# Altium schematic sheet USB HUB_Section.SchDoc
size 420 x 297 mm; SheetNumber: 6; SheetTotal: 6
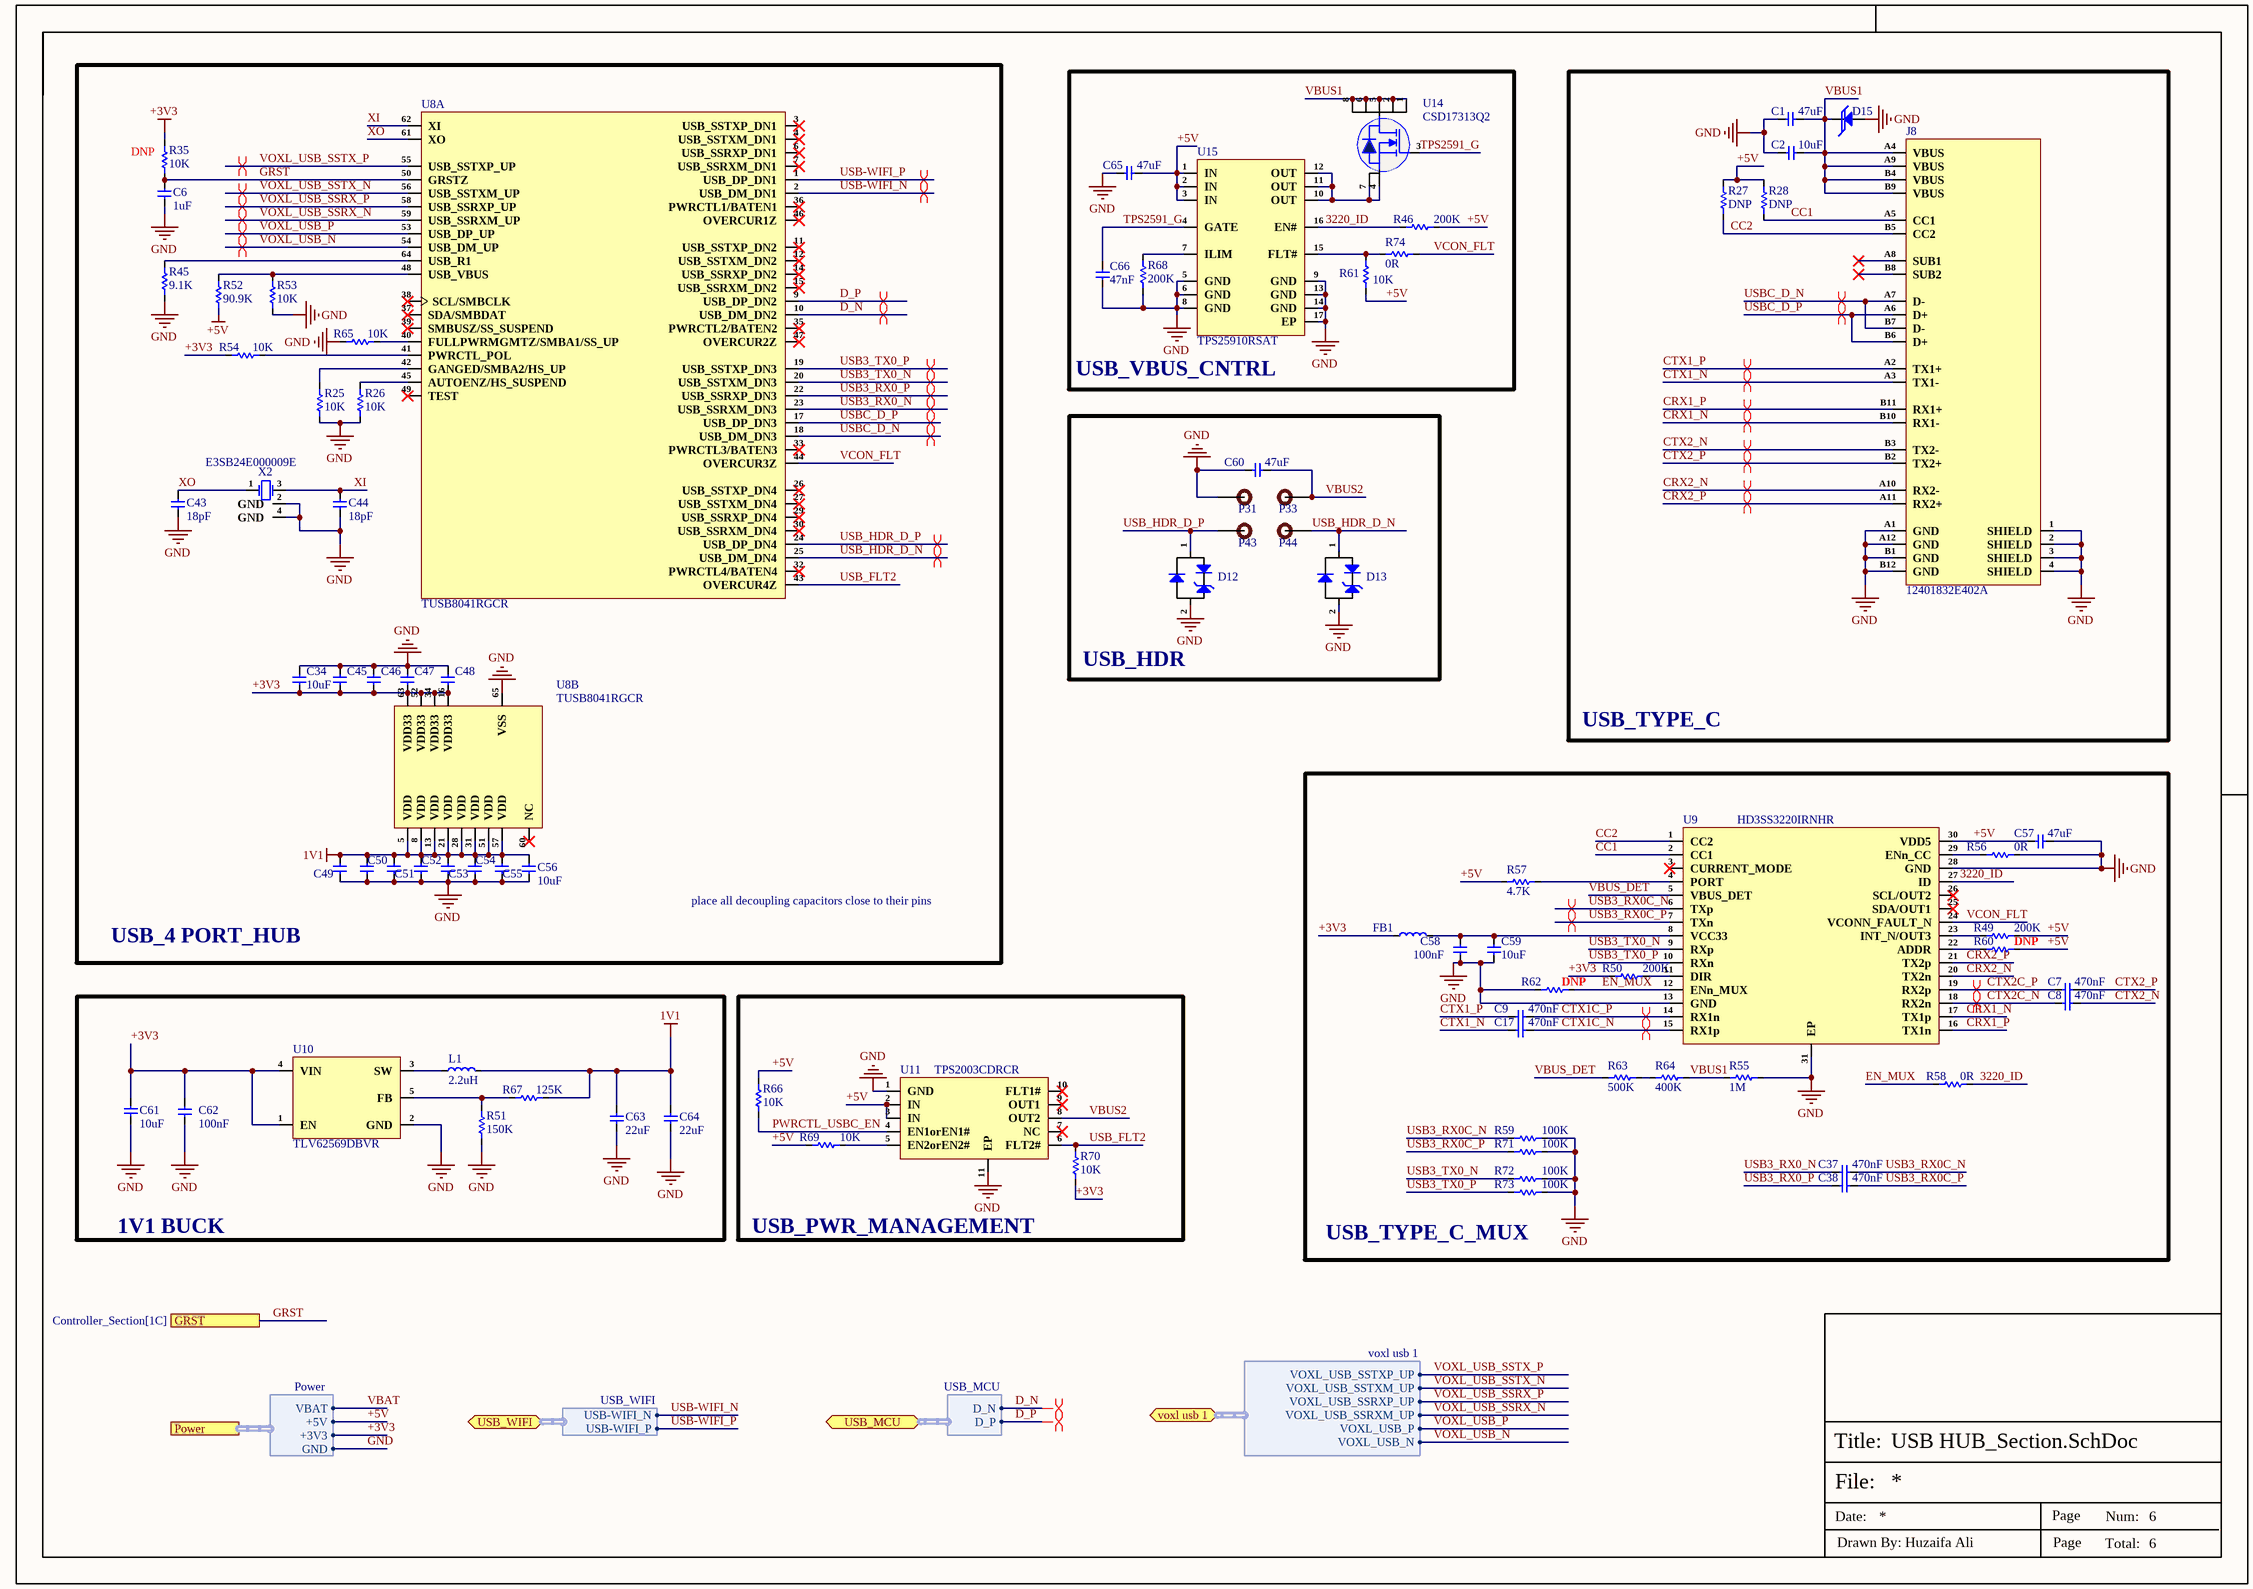
[diagram p0: USB HUB_Section.SchDoc]

## Parts
C1  47uF  [Cap-0805]
C2  10uF  [Cap-0603]
C6  1uF  [Cap-0402]
C7  470nF  [Cap-0402]
C8  470nF  [Cap-0402]
C9  470nF  [Cap-0402]
C17  470nF  [Cap-0402]
C34  10uF  [Cap-0603]
C37  470nF  [Cap-0402]
C38  470nF  [Cap-0402]
C43  18pF  [Cap-0402]
C44  18pF  [Cap-0402]
C45  0.01uF  [Cap-0402]  (value not drawn)
C46  0.01uF  [Cap-0402]  (value not drawn)
C47  0.01uF  [Cap-0402]  (value not drawn)
C48  0.01uF  [Cap-0402]  (value not drawn)
C49  0.01uF  [Cap-0402]  (value not drawn)
C50  0.01uF  [Cap-0402]  (value not drawn)
C51  0.01uF  [Cap-0402]  (value not drawn)
C52  0.01uF  [Cap-0402]  (value not drawn)
C53  0.01uF  [Cap-0402]  (value not drawn)
C54  0.01uF  [Cap-0402]  (value not drawn)
C55  0.01uF  [Cap-0402]  (value not drawn)
C56  10uF  [Cap-0603]
C57  47uF  [Cap-0805]
C58  100nF  [cap-0402]
C59  10uF  [Cap-0603]
C60  47uF  [Cap-0805]
C61  10uF  [Cap-0603]
C62  100nF  [cap-0402]
C63  22uF  [Cap-0402]
C64  22uF  [Cap-0402]
C65  47uF  [Cap-0805]
C66  47nF  [Cap-0402]
D12  ESD5341N-2/TR  [DFN1006-2L_]  (value not drawn)
D13  ESD5341N-2/TR  [DFN1006-2L_]  (value not drawn)
D15  ESD5Z6.0T1G  [SOD-523]  (value not drawn)
FB1  HPZ1005D221R50TF  [IND-0402]  (value not drawn)
J8  12401832E402A  [12401832E402A]
L1  2.2uH  [YSPI0520-2R2M_]
P31  TEST POINT  [Test-point]  (value not drawn)
P33  TEST POINT  [Test-point]  (value not drawn)
P43  TEST POINT  [Test-point]  (value not drawn)
P44  TEST POINT  [Test-point]  (value not drawn)
R25  10K  [Res-0402]
R26  10K  [Res-0402]
R27  DNP  [Res-0402]
R28  DNP  [Res-0402]
R35  10K  [Res-0402]
R45  9.1K  [Res-0402]
R46  200K  [Res-0402]
R49  200K  [Res-0402]
R50  200K  [Res-0402]
R51  150K  [Res-0402]
R52  90.9K  [Res-0402]
R53  10K  [Res-0402]
R54  10K  [Res-0402]
R55  1M  [Res-0603]
R56  0R  [Res-0402]
R57  4.7K  [Res-0402]
R58  0R  [Res-0402]
R59  100K  [Res-0402]
R60  DNP  [Res-0402]
R61  10K  [Res-0402]
R62  DNP  [Res-0402]
R63  500K  [Res-0603]
R64  400K  [RES-0805]
R65  10K  [Res-0402]
R66  10K  [Res-0402]
R67  125K  [RES-0805]
R68  200K  [Res-0402]
R69  10K  [Res-0402]
R70  10K  [Res-0402]
R71  100K  [Res-0402]
R72  100K  [Res-0402]
R73  100K  [Res-0402]
R74  0R  [Res-0402]
U8  TUSB8041RGCR  [64-VQFN (9x9)]  (parts A,B of 2)
U9  HD3SS3220IRNHR  [WQFN-30-EP(2.5x4.5)]
U10  TLV62569DBVR  [SOT-23-5]
U11  TPS2003CDRCR  [VSON-10-EP(3x3)]
U14  CSD17313Q2  [CSD17313Q2]
U15  TPS25910RSAT  [16-QFN (4x4)]
X2  E3SB24E000009E  [SMD3225-4P]

## Blocks framed on the sheet
USB_4 PORT_HUB: C6 C34 C43-C56 R25 R26 R35 R45 R52-R54 R65 U8 X2
USB_VBUS_CNTRL: C65 C66 R46 R61 R68 R74 U14 U15
USB_TYPE_C: C1 C2 D15 J8 R27 R28
USB_HDR: C60 D12 D13 P31 P33 P43 P44
USB_TYPE_C_MUX: C7-C9 C17 C37 C38 C57-C59 FB1 R49 R50 R55-R60 R62-R64 R71-R73 U9
1V1 BUCK: C61-C64 L1 R51 R67 U10
USB_PWR_MANAGEMENT: R66 R69 R70 U11

## Ports
GRST (see Controller_Section[1C]), Power (harness Power, see Connector_Section[4D], Controller_Section[2D], FlashMemory_Section[1D], Power_Section[3D], RTC_Section[2D], WiFiModule_Section[3D]), USB_MCU (bidir, harness USB_MCU, see Controller_Section[2D]), USB_WIFI (bidir, harness USB_WIFI, see WiFiModule_Section[3D]), voxl usb 1 (bidir, harness voxl usb 1, see Connector_Section[4D])

## Harnesses
Power: +5V, +3V3, GND, VBAT
USB_WIFI: USB-WIFI_N, USB-WIFI_P
USB_MCU: D_N, D_P
voxl usb 1: VOXL_USB_SSTXP_UP, VOXL_USB_SSTXM_UP, VOXL_USB_SSRXP_UP, VOXL_USB_SSRXM_UP, VOXL_USB_P, VOXL_USB_N

## Nets
1V1: C49.2 C50.2 C51.2 C52.2 C53.2 C54.2 C55.2 C56.2 C63.2 C64.2 L1.2 R67.2 U8.5(VDD) U8.8(VDD) U8.13(VDD) U8.21(VDD) U8.28(VDD) U8.31(VDD) U8.51(VDD) U8.57(VDD)
+3V3: C34.1 C45.1 C46.1 C47.1 C48.1 C61.1 C62.2 FB1.1 R35.2 R50.2 R54.2 R70.1 U8.16(VDD33) U8.34(VDD33) U8.52(VDD33) U8.63(VDD33) U10.1(EN) U10.4(VIN) ; port Power.+3V3
+5V: C57.1 C65.2 R27.2 R28.2 R46.2 R49.1 R52.1 R57.1 R60.1 R61.1 R66.2 R69.1 U9.30(VDD5) U11.2(IN) U11.3(IN) U15.1(IN) U15.2(IN) U15.3(IN) ; port Power.+5V
GND: C1.1 C2.2 C6.1 C34.2 C43.1 C44.1 C45.2 C46.2 C47.2 C48.2 C49.1 C50.1 C51.1 C52.1 C53.1 C54.1 C55.1 C56.1 C57.2 C58.1 C59.1 C60.1 C61.2 C62.1 C63.1 C64.1 C65.1 C66.1 D12.2(A) D13.2(A) D15.1 J8.1(SHIELD) J8.2(SHIELD) J8.3(SHIELD) J8.4(SHIELD) J8.A1(GND) J8.A12(GND) J8.B1(GND) J8.B12(GND) P31.1 R25.1 R26.1 R45.1 R51.1 R53.2 R55.2 R56.2 R59.2 R62.1 R65.2 R68.1 R71.2 R72.2 R73.2 U8.65(VSS) U9.13(GND) U9.28(GND) U9.31(EP) U10.2(GND) U11.1(GND) U11.11(EP) U15.5(GND) U15.6(GND) U15.8(GND) U15.9(GND) U15.13(GND) U15.14(GND) U15.17(EP) X2.2(GND) X2.4(GND) ; port Power.GND
3220_ID: R46.1 R58.2 U9.27(ID) U15.16(EN#)
CC1: J8.A5(CC1) R28.1 U9.2(CC1)
CC2: J8.B5(CC2) R27.1 U9.1(CC2)
CRX1_N: J8.B10(RX1-) U9.17(TX1p)
CRX1_P: J8.B11(RX1+) U9.16(TX1n)
CRX2_N: J8.A10(RX2-) U9.20(TX2n)
CRX2_P: J8.A11(RX2+) U9.21(TX2p)
CTX1_N: C17.1 J8.A3(TX1-)
CTX1_P: C9.1 J8.A2(TX1+)
CTX1C_N: C17.2 U9.15(RX1p)
CTX1C_P: C9.2 U9.14(RX1n)
CTX2_N: C8.2 J8.B3(TX2-)
CTX2_P: C7.2 J8.B2(TX2+)
CTX2C_N: C8.1 U9.18(RX2n)
CTX2C_P: C7.1 U9.19(RX2p)
D_N: U8.10(USB_DM_DN2) ; port USB_MCU.D_N
D_P: U8.9(USB_DP_DN2) ; port USB_MCU.D_P
EN_MUX: R58.1 R62.2 U9.12(ENn_MUX)
GRST: C6.2 R35.1 U8.50(GRSTZ) ; port GRST
PWRCTL_USBC_EN: R66.1 U11.4(EN1orEN1#)
TPS2591_G: C66.2 U14.3(G) U15.4(GATE)
USB3_RX0_N: C37.1 U8.23(USB_SSRXM_DN3)
USB3_RX0_P: C38.1 U8.22(USB_SSRXP_DN3)
USB3_RX0C_N: C37.2 R59.1 U9.6(TXp)
USB3_RX0C_P: C38.2 R71.1 U9.7(TXn)
USB3_TX0_N: R72.1 U8.20(USB_SSTXM_DN3) U9.9(RXp)
USB3_TX0_P: R73.1 U8.19(USB_SSTXP_DN3) U9.10(RXn)
USB-WIFI_N: U8.2(USB_DM_DN1) ; port USB_WIFI.USB-WIFI_N
USB-WIFI_P: U8.1(USB_DP_DN1) ; port USB_WIFI.USB-WIFI_P
USB_FLT2: R70.2 U8.43(OVERCUR4Z) U11.6(FLT2#)
USB_HDR_D_N: D13.1(K) P44.1 U8.25(USB_DM_DN4)
USB_HDR_D_P: D12.1(K) P43.1 U8.24(USB_DP_DN4)
USBC_D_N: J8.A7(D-) J8.B7(D-) U8.18(USB_DM_DN3)
USBC_D_P: J8.A6(D+) J8.B6(D+) U8.17(USB_DP_DN3)
VBAT: port Power.VBAT
VBUS1: C1.2 C2.1 D15.2 J8.A4(VBUS) J8.A9(VBUS) J8.B4(VBUS) J8.B9(VBUS) R55.1 R64.1 U14.1(D) U14.2(D) U14.5(D) U14.6(D) U14.8(D)
VBUS2: C60.2 P33.1 U11.8(OUT2)
VBUS_DET: R63.2 U9.5(VBUS_DET)
VCON_FLT: R74.2 U8.44(OVERCUR3Z) U9.24(VCONN_FAULT_N)
VOXL_USB_N: U8.54(USB_DM_UP) ; port voxl usb 1.VOXL_USB_N
VOXL_USB_P: U8.53(USB_DP_UP) ; port voxl usb 1.VOXL_USB_P
VOXL_USB_SSRX_N: U8.59(USB_SSRXM_UP) ; port voxl usb 1.VOXL_USB_SSRXM_UP
VOXL_USB_SSRX_P: U8.58(USB_SSRXP_UP) ; port voxl usb 1.VOXL_USB_SSRXP_UP
VOXL_USB_SSTX_N: U8.56(USB_SSTXM_UP) ; port voxl usb 1.VOXL_USB_SSTXM_UP
VOXL_USB_SSTX_P: U8.55(USB_SSTXP_UP) ; port voxl usb 1.VOXL_USB_SSTXP_UP
XI: C44.2 U8.62(XI) X2.3(OSC2)
XO: C43.2 U8.61(XO) X2.1(OSC1)
NetC58_2: C58.2 C59.2 FB1.2 U9.8(VCC33)
NetL1_1: L1.1 U10.3(SW)
NetR25_2: R25.2 U8.42(GANGED/SMBA2/HS_UP)
NetR26_2: R26.2 U8.45(AUTOENZ/HS_SUSPEND)
NetR45_2: R45.2 U8.64(USB_R1)
NetR49_2: R49.2 U9.23(INT_N/OUT3)
NetR50_1: R50.1 U9.11(DIR)
NetR51_2: R51.2 R67.1 U10.5(FB)
NetR52_2: R52.2 R53.1 U8.48(USB_VBUS)
NetR54_1: R54.1 U8.41(PWRCTL_POL)
NetR56_1: R56.1 U9.29(ENn_CC)
NetR57_2: R57.2 U9.4(PORT)
NetR60_2: R60.2 U9.22(ADDR)
NetR61_2: R61.2 R74.1 U15.15(FLT#)
NetR63_1: R63.1 R64.2
NetR65_1: R65.1 U8.40(FULLPWRMGMTZ/SMBA1/SS_UP)
NetR68_2: R68.2 U15.7(ILIM)
NetR69_2: R69.2 U11.5(EN2orEN2#)
NetU14_4: U14.4(S) U14.7(S) U15.10(OUT) U15.11(OUT) U15.12(OUT)

Not connected (* = marked no-connect by the designer): J8 A8(SUB1)* B8(SUB2)*; U8 3(USB_SSTXP_DN1)* 4(USB_SSTXM_DN1)* 6(USB_SSRXP_DN1)* 7(USB_SSRXM_DN1)* 11(USB_SSTXP_DN2)* 12(USB_SSTXM_DN2)* 14(USB_SSRXP_DN2)* 15(USB_SSRXM_DN2)* 26(USB_SSTXP_DN4)* 27(USB_SSTXM_DN4)* 29(USB_SSRXP_DN4)* 30(USB_SSRXM_DN4)* 32(PWRCTL4/BATEN4)* 33(PWRCTL3/BATEN3)* 35(PWRCTL2/BATEN2)* 36(PWRCTL1/BATEN1)* 37(SDA/SMBDAT)* 38(SCL/SMBCLK)* 39(SMBUSZ/SS_SUSPEND)* 46(OVERCUR1Z)* 47(OVERCUR2Z)* 49(TEST)* 60(NC)*; U9 3(CURRENT_MODE)* 25(SDA/OUT1)* 26(SCL/OUT2)*; U11 7(NC)* 9(OUT1)* 10(FLT1#)*

## Layout directives
differential pair; rule Impedance Constraint [Min = 88.00    Max = 102.0    ]; rule Matched Net Lengths [Tolerance = 0.508mm]; net class D; differential pair class D_Lines: D_N, D_P, USB-WIFI_N, USB-WIFI_P, USB_HDR_D_N, USB_HDR_D_P, USBC_D_N, USBC_D_P
differential pair; differential pair class DP_LINES: CRX1_N, CRX1_P, CRX2_N, CRX2_P, CTX1_N, CTX1_P, CTX1C_N, CTX1C_P, CTX2_N, CTX2_P, CTX2C_N, CTX2C_P, USB3_RX0C_N, USB3_RX0C_P
differential pair; rule Impedance Constraint [Min = 88.00    Max = 102.0    ]; rule Matched Net Lengths [Tolerance = 0.508mm]; net class D_SS; differential pair class D_SS_Lines: USB3_RX0_N, USB3_RX0_P, USB3_TX0_N, USB3_TX0_P
differential pair; differential pair class USB_LINES: USBC_D_N, USBC_D_P
differential pair; net class VOXL_SS_USB; differential pair class VOXL_SS_USB_Lines; rule Matched Net Lengths [Tolerance = 0.508mm]; rule Impedance Constraint [Min = 88.00    Max = 102.0    ]: VOXL_USB_SSRX_N, VOXL_USB_SSRX_P, VOXL_USB_SSTX_N, VOXL_USB_SSTX_P
differential pair; net class VOXL_USB; differential pair class VOXL_USB_Lines; rule Matched Net Lengths [Tolerance = 0.508mm]; rule Impedance Constraint [Min = 88.00    Max = 102.0    ]: VOXL_USB_N, VOXL_USB_P

## Notes on the sheet
- (near R35) DNP
- place all decoupling capacitors close to their pins
- File:
- Title:
- Date:
- Page
- Num:
- Total:
- Drawn By: Huzaifa Ali

## Library data of the parts
C1 C57 C60 C65 = CGA0805X5R476M100MT: 10V 47uF X5R ±20% 0805 Multilayer Ceramic Capacitors MLCC - SMD/SMT ROHS; Manufacturer: HRE; ComponentLink1Description: LCSC; ComponentLink1URL: https://www.lcsc.com/product-detail/Multilayer-Ceramic-Capacitors-MLCC-SMD-SMT_HRE-CGA0805X5R476M100MT_C6119904.html; Manufacturer Part Number: CGA0805X5R476M100MT; Package: 0805; LCSC Part Number: C6119904; Item Type: Capacitor
C2 C34 C56 C59 C61 = GRM188R61E106KA73D: CAP CER 10UF 25V X5R 0603; Manufacturer: Murata; Supplier 1: Mouser; Manufacturer Part Number: GRM188R61E106KA73D; RoHS: Yes; Category: Ceramic Capacitors; Stock 1: 319428; Pricing 1: 1=0.36000, 10=0.25800, 50=0.25800, 100=0.15500, 1000=0.09800, 10000=0.06900 (USD); Case/Package: 0603; RoHS Compliant: Yes; ComponentLink1URL: https://search.murata.co.jp/Ceramy/image/img/A01X/G101/ENG/GRM188R61E106KA73-01.pdf?src-supplier=Digi-Key; ComponentLink1Description: https://search.murata.co.jp/Ceramy/image/img/A01X/G101/ENG/GRM188R61E106KA73-01.pdf?src-supplier=Digi-Key; Supplier Part Number 1: 81-GRM188R61E106KA3D; LCSC Part Number: C344022
C6 = CC0402KRX5R8BB105: CAP CER 1UF 25V X5R 0402; Manufacturer: Yageo; Tolerance: 10%; Supplier 1: Mouser; Manufacturer Part Number: CC0402KRX5R8BB105; RoHS: Yes; Category: Ceramic Capacitors; Stock 1: 91975; Pricing 1: 1=0.30000, 10=0.20400, 50=0.20400, 100=0.11600, 1000=0.07200, 10000=0.05900 (USD); Mount: Surface Mount; Case/Package: 0402; Case Code (Metric): 1005; Case Code (Imperial): 0402; Weight: 2.3E-05oz; Min Operating Temperature: -55°C; Max Operating Temperature: 85°C; Packaging: Tape and Reel; Capacitance: 1uF; Voltage Rating: 25V; Dielectric: X5R; Termination: SMD/SMT; Voltage Rating (DC): 25V; Package Quantity: 10000; Length: 0.039inch; Width: 0.02inch; Thickness: 0.022inch; Lead Free: Lead Free; Halogen Free: Halogen Free; RoHS Compliant: Yes; ComponentLink1URL: http://www.mouser.com/ds/2/447/Yageo_UPY-GP_NP0_16V-to-50V_9-358835.pdf?src-supplier=Mouser; ComponentLink1Description: http://www.mouser.com/ds/2/447/Yageo_UPY-GP_NP0_16V-to-50V_9-358835.pdf?src-supplier=Mouser; ComponentLink2URL: http://www.yageo.com/documents/recent/UPY-GPHC_X5R_4V-to-50V_25.pdf?src-supplier=Digi-Key; ComponentLink2Description: http://www.yageo.com/documents/recent/UPY-GPHC_X5R_4V-to-50V_25.pdf?src-supplier=Digi-Key; ComponentLink3URL: https://4donline.ihs.com/images/VipMasterIC/IC/YAGO/YAGO-S-A0006851646/YAGO-S-A0006851646-1.pdf?hkey=6D3A4C79FDBF58556ACFDE234799DDF0&src-supplier=Newark; ComponentLink3Description: https://4donline.ihs.com/images/VipMasterIC/IC/YAGO/YAGO-S-A0006851646/YAGO-S-A0006851646-1.pdf?hkey=6D3A4C79FDBF58556ACFDE234799DDF0&src-supplier=Newark; Supplier Part Number 1: 603-CC402KRX5R8BB105; LCSC Part Number: C326568
C7-C9 C17 C37 C38 = CL05A474KA5NNNC: CAP CER 0.47UF 25V X5R 0402; Manufacturer: Samsung; Material: Ceramic; Tolerance: 10%; Supplier: Avnet; Supplier Part Number: CL05A474KA5NNNC; Manufacturer Part Number: CL05A474KA5NNNC; RoHS: Yes; Category: Ceramic Capacitors; Stock: 80000; Pricing: 100000=0.02563 (USD); Mounting Technology: Surface Mount; Case/Package: 0402; Case Code (Metric): 1005; Case Code (Imperial): 0402; Min Operating Temperature: -55°C; Max Operating Temperature: 85°C; Packaging: Cut Tape; Value: 470nF; Voltage Rating (DC): 25V; Voltage Rating: 25V; Series: CL; Height: 550um; Lead Free: Lead Free; RoHS Compliant: Yes; ComponentLink1URL: https://datasheet.ciiva.com/25796/cl05a474ka5nnnc-25796037.pdf?src-supplier=Digikey; ComponentLink1Description: https://datasheet.ciiva.com/25796/cl05a474ka5nnnc-25796037.pdf?src-supplier=Digikey; ComponentLink2URL: https://datasheet.ciiva.com/29198/458859-da-01-en-vs-kondensator-0402-29198303.pdf?src-supplier=Conrad; ComponentLink2Description: https://datasheet.ciiva.com/29198/458859-da-01-en-vs-kondensator-0402-29198303.pdf?src-supplier=Conrad
C43 C44 = GCM1555C1H180GA16D: CAP CER 18PF 50V C0G/NP0 0402; Manufacturer: Murata; Tolerance: 2%; Item Type: Capacitor; Supplier: Rs; Supplier Part Number: 2477793P; Manufacturer Part Number: GCM1555C1H180GA16D; RoHS: Yes; Category: Ceramic Capacitors; Stock: 10000; Pricing: 500=0.013, 5000=0.009 (GBP); Mounting Technology: Surface Mount; Case/Package: 0402; Case Code (Imperial): 0402; Case Code (Metric): 1005; Min Operating Temperature: -55°C; Max Operating Temperature: 125°C; Packaging: Cut Tape; Value: 18pF; Voltage Rating: 50V; Series: GCM; Ratings: AEC-Q200; RoHS Compliant: Yes; ComponentLink1URL: http://search.murata.co.jp/Ceramy/image/img/A01X/G101/ENG/GCM1555C1H180GA16-01.pdf?src-supplier=Digi-Key; ComponentLink1Description: http://search.murata.co.jp/Ceramy/image/img/A01X/G101/ENG/GCM1555C1H180GA16-01.pdf?src-supplier=Digi-Key; ComponentLink2URL: https://search.murata.co.jp/Ceramy/image/img/A01X/G101/ENG/GCM1555C1H180GA16-01.pdf?src-supplier=Digi-Key; ComponentLink2Description: https://search.murata.co.jp/Ceramy/image/img/A01X/G101/ENG/GCM1555C1H180GA16-01.pdf?src-supplier=Digi-Key; ComponentLink3URL: https://datasheet.octopart.com/GCM1555C1H180GA16D-Murata-datasheet-149522315.pdf?src-supplier=Newark; ComponentLink3Description: https://datasheet.octopart.com/GCM1555C1H180GA16D-Murata-datasheet-149522315.pdf?src-supplier=Newark; ComponentLink4URL: https://datasheet.octopart.com/GCM1555C1H180GA16D-Murata-datasheet-12511495.pdf?src-supplier=TME; ComponentLink4Description: https://datasheet.octopart.com/GCM1555C1H180GA16D-Murata-datasheet-12511495.pdf?src-supplier=TME; LCSC Part Number: C882583
C45-C55 = CC0402KRX5R8BB103: CAP CER 10000PF 25V X5R 0402; Manufacturer: Yageo; Item Type: Capacitor; Supplier 1: Future Electronics; Manufacturer Part Number: CC0402KRX5R8BB103; RoHS: Yes; Category: Ceramic Capacitors; Stock 1: 140000; Pricing 1: 10000=0.00290, 40000=0.00270, 150000=0.00260, 250000=0.00250, 500000=0.00240 (USD); RoHS Compliant: Yes; Supplier Part Number 1: 2101932; LCSC Part Number: C576726; ComponentLink1Description: LCSC; ComponentLink1URL: https://www.lcsc.com/product-detail/Multilayer-Ceramic-Capacitors-MLCC-SMD-SMT_YAGEO-CC0402KRX5R8BB103_C576726.html
C58 C62 = C1005X7R1H104KT000F: CAP CER 0.1UF 50V X7R 0402; Manufacturer: TDK; Tolerance: 10%; Voltage: 25V; Item Type: Capacitor; Supplier 1: Avnet; Manufacturer Part Number: C1005X7R1H104KT000F; RoHS: No; Category: Ceramic Capacitors; Dielectric: X7R; Supplier Part Number 1: C1005X7R1H104KT000F; LCSC Part Number: C361198; ComponentLink1Description: LCSC; ComponentLink1URL: https://www.lcsc.com/product-detail/Multilayer-Ceramic-Capacitors-MLCC-SMD-SMT_TDK-C1005X7R1H104KT000F_C361198.html
C63 C64 = GRM158R61A226ME15D: Surface Mount Ceramic Multilayer Capacitor 100pF 2% C0G 50V 0201 Paper T/R; Manufacturer: Murata; Material: 4241ConductorMaterial; Dielectric: 1537DielectricType; Tolerance: 20%; Voltage Rating: 10V; Supplier: Mouser; Supplier Part Number: 81-GRM158R61A226ME5D; Manufacturer Part Number: GRM158R61A226ME15D; RoHS: Yes; Stock: 328944; Pricing: 1=0.46, 10=0.225, 50=0.225, 100=0.146, 1000=0.124, 10000=0.106 (USD); Case/Package: 343Case; Min Operating Temperature: -55°C; Max Operating Temperature: 85°C; Value: 22uF; Voltage Rating (DC): 10V; Length: 1mm; Width: 500um; Height: 800um; Thickness: 800um; LCSC Part Number: C3845593; Item Type: Capacitor; Category: Ceramic Capacitors
C66 = CC0402KRX7R9BB473: CAP CER 0.047UF 50V X7R 0402; Manufacturer: Yageo; Material: 4241ConductorMaterial; Tolerance: 10%; Temperature Coefficient: 30ppm/°C; Dielectric: 1511DielectricType; Item Type: Capacitor; Supplier: Future Electronics; Supplier Part Number: 2095687; Manufacturer Part Number: CC0402KRX7R9BB473; RoHS: Yes; Category: Ceramic Capacitors; Stock: 1130000; Pricing: 10000=0.0044, 40000=0.0042, 100000=0.004, 150000=0.0041, 250000=0.0039, 400000=0.0037, 500000=0.0038 (USD); Mounting Technology: Surface Mount; Case/Package: 0402; Case Code (Imperial): 0402; Case Code (Metric): 1005; Min Operating Temperature: -55°C; Max Operating Temperature: 125°C; Packaging: Tape and Reel; Value: 47nF; Voltage Rating: 50V; Series: CC; Voltage Rating (DC): 50V; Length: 0.039inch; Width: 0.02inch; Height: 550um; Thickness: 0.022inch; RoHS Compliant: Yes; Halogen Free: 5694HalogenFree; Lead Free: 5697LeadFree; ComponentLink1URL: https://datasheet.octopart.com/CC0402KRX7R9BB473-Yageo-datasheet-166511530.pdf?src-supplier=Future+Electronics; ComponentLink1Description: https://datasheet.octopart.com/CC0402KRX7R9BB473-Yageo-datasheet-166511530.pdf?src-supplier=Future+Electronics; ComponentLink2URL: http://www.yageo.com/documents/recent/UPY-GPHC_X7R_6.3V-to-50V_18.pdf?src-supplier=Digikey; ComponentLink2Description: http://www.yageo.com/documents/recent/UPY-GPHC_X7R_6.3V-to-50V_18.pdf?src-supplier=Digikey; ComponentLink3URL: https://datasheet.octopart.com/CC0402KRX7R9BB473-Yageo-datasheet-140260305.pdf?src-supplier=Newark; ComponentLink3Description: https://datasheet.octopart.com/CC0402KRX7R9BB473-Yageo-datasheet-140260305.pdf?src-supplier=Newark; LCSC Part Number: C272875
D12 D13 = ESD5341N-2/TR: 4A@8/20us 15V 7V 5V Unidirectional DFN1006-2L TVS ROHS; Manufacturer: WILLSEMI; Item Type: Diode; Manufacturer Part Number: ESD5341N-2/TR; Package: DFN1006-2L; ComponentLink1Description: LCSC; ComponentLink1URL: https://www.lcsc.com/product-detail/TVS_WILLSEMI-Will-Semicon-ESD5341N-2-TR_C239773.html; LCSC Part Number: C239773
D15 = ESD5Z6.0T1G: SOD-523 ESD and Surge Protection (TVS/ESD) ROHS; Manufacturer: TECH PUBLIC; Manufacturer Part Number: ESD5Z6.0T1G; Package: SOD-523; LCSC Part Number: C2890110; Item Type: (TVS/ESD); ComponentLink1Description: LCSC; ComponentLink1URL: https://www.lcsc.com/product-detail/span-style-background-color-ff0-ESD-span-and-Surge-Protection-TVS-span-style-background-color-ff0-ESD-span_TECH-PUBLIC-ESD5Z6-0T1G_C2890110.html
FB1 = HPZ1005D221R50TF: FERRITE BEAD 220 OHM 0402 1LN; Manufacturer: Sunlord; Item Type: Ferrite Beads; Supplier: Digikey; LCSC Part Number: C369802; Manufacturer Part Number: HPZ1005D221R50TF; RoHS: No; Stock: 29750; Pricing: 1=0.14, 10=0.114, 25=0.0884, 50=0.0732, 100=0.0631, 250=0.05048, 500=0.04544, 1000=0.03788, 5000=0.03535 (USD)
J8 = 12401832E402A: CONN RCP USB3.1 TYPEC 24P SMD RA; Manufacturer: Amphenol; Item Type: USB Connectors; Supplier: Avnet; LCSC Part Number: C464604; Manufacturer Part Number: 12401832E402A; RoHS: No; Stock: 6472; Pricing: 1=1.33, 25=1.17, 100=1.04, 250=1.01, 500=0.976 (USD); ComponentLink1URL: https://media.digikey.com/pdf/Data%20Sheets/Amphenol%20PDFs/12401832E402A_Dwg_RevX1_04-25-17.pdf?src-supplier=Digikey; ComponentLink1Description: https://media.digikey.com/pdf/Data%20Sheets/Amphenol%20PDFs/12401832E402A_Dwg_RevX1_04-25-17.pdf?src-supplier=Digikey
L1 = YSPI0520-2R2M: 4A 2.2uH ±20% 32mΩ SMD,5.4x5.2x2mm Power Inductors ROHS; Manufacturer: YJYCOIN; Manufacturer Part Number: YSPI0520-2R2M; Footprint: Custom; ComponentLink1Description: LCSC; ComponentLink1URL: https://www.lcsc.com/product-detail/Power-Inductors_YJYCOIN-YSPI0520-2R2M_C718375.html; LCSC Part Number: C718375; Item Type: Inductor
P31 P33 P43 P44 = TEST POINT: Test Point ON; Item Type: TEST POINT; Manufacturer Part Number: TEST POINT
R25 R26 R35 R53 R54 R60 R61 R65 R66 R69 R70 = RC0402FR-0710KL: RES 10K OHM 1% 1/16W 0402; Manufacturer: Yageo; Resistance: 10kR; Voltage Rating (DC): 50V; Temperature Coefficient: 100ppm/°C; Power Rating: 62.5mW; Max Power Dissipation: 63mW; Item Type: Resistor; Supplier 1: Mouser; Manufacturer Part Number: RC0402FR-0710KL; RoHS: Yes; Category: Chip SMD Resistors; Stock 1: 18648329; Pricing 1: 1=0.10000, 10=0.01400, 50=0.01400, 100=0.00500, 1000=0.00300, 10000=0.00200 (USD); Case/Package: 0402; Number of Pins: 2; Case Code (Imperial): 0402; Case Code (Metric): 1005; Min Operating Temperature: -55°C; Max Operating Temperature: 155°C; Resistor Type: Thick Film; Tolerance: 1%; Packaging: Tape and Reel; Voltage Rating: 50V; Termination: SMD/SMT; Working Voltage: 50V; Number of Terminations: 2; Features: Moisture Resistant; Series: RC; Resistance Tolerance: 1%; Construction: Rectangular; Length: 1mm; Width: 0.5mm; Height: 0.32mm; Depth: 0.5mm; Lead Pitch: 0.2mm; REACH SVHC: No SVHC; Lead Free: Lead Free; RoHS Compliant: Yes; Military Standard: Not; ComponentLink1URL: https://datasheet.ciiva.com/7660/38568-7660787.pdf?src-supplier=Element14; ComponentLink1Description: https://datasheet.ciiva.com/7660/38568-7660787.pdf?src-supplier=Element14; ComponentLink2URL: https://datasheet.ciiva.com/7849/1686128-7849814.pdf?src-supplier=Element14; ComponentLink2Description: https://datasheet.ciiva.com/7849/1686128-7849814.pdf?src-supplier=Element14; ComponentLink3URL: https://datasheet.ciiva.com/7983/1018594-7983486.pdf?src-supplier=Element14; ComponentLink3Description: https://datasheet.ciiva.com/7983/1018594-7983486.pdf?src-supplier=Element14; ComponentLink4URL: https://datasheet.ciiva.com/22747/1018594-22747512.pdf?src-supplier=Element14; ComponentLink4Description: https://datasheet.ciiva.com/22747/1018594-22747512.pdf?src-supplier=Element14; ComponentLink5URL: https://datasheet.ciiva.com/12667/pyu-rc0402-51-rohs-l-6-r-12667067.pdf?src-supplier=Mouser; ComponentLink5Description: https://datasheet.ciiva.com/12667/pyu-rc0402-51-rohs-l-6-r-12667067.pdf?src-supplier=Mouser; ComponentLink6URL: https://datasheet.ciiva.com/7849/1784430-7849813.pdf?src-supplier=Element14; ComponentLink6Description: https://datasheet.ciiva.com/7849/1784430-7849813.pdf?src-supplier=Element14; ComponentLink7URL: https://datasheet.ciiva.com/7849/1784430-7849815.pdf?src-supplier=Element14; ComponentLink7Description: https://datasheet.ciiva.com/7849/1784430-7849815.pdf?src-supplier=Element14; Supplier Part Number 1: 603-RC0402FR-0710KL; LCSC Part Number: C60490
R27 R28 = RC0402FR-0756KL: RES 56K OHM 1% 1/16W 0402; Manufacturer: Yageo; Power Rating: 62.5mW; Temperature Coefficient: 100ppm/°C; Value: 56kR; Voltage Rating: 50V; Max Power Dissipation: 63mW; Item Type: Resistor; Supplier 1: Future Electronics; Manufacturer Part Number: RC0402FR-0756KL; RoHS: Yes; Category: Chip SMD Resistors; Stock 1: 2610000; Pricing 1: 10000=0.001, 50000=0.001, 300000=0.0009, 1000000=0.0009, 3000000=0.0008 (USD); Case/Package: 0402; Case Code (Metric): 1005; Case Code (Imperial): 0402; Min Operating Temperature: -55°C; Max Operating Temperature: 155°C; Tolerance: 1%; Series: RC; Technology: THICK FILM; Package Quantity: 1; Packaging: Tape and Reel; Resistor Type: Thick Film; Number of Terminations: 2; Termination: SMD/SMT; Working Voltage: 50V; Features: Moisture Resistant; Construction: Rectangular; Resistance Tolerance: 1%; Length: 0.039inch; Width: 0.02inch; Height: 0.016inch; Depth: 0.5mm; RoHS Compliant: Yes; Reach SVHC Compliant: No; Military Standard: Not; Lead Free: Lead Free; ComponentLink1URL: https://datasheet.ciiva.com/46412/1018594-46412840.pdf?src-supplier=Element14; ComponentLink1Description: https://datasheet.ciiva.com/46412/1018594-46412840.pdf?src-supplier=Element14; ComponentLink2URL: https://datasheet.ciiva.com/2453/pyu-r-int-thick-7-2453479.pdf?src-supplier=Digi-Key; ComponentLink2Description: https://datasheet.ciiva.com/2453/pyu-r-int-thick-7-2453479.pdf?src-supplier=Digi-Key; ComponentLink3URL: https://datasheet.ciiva.com/2453/pyu-r-int-thick-7-2453480.pdf?src-supplier=Digi-Key; ComponentLink3Description: https://datasheet.ciiva.com/2453/pyu-r-int-thick-7-2453480.pdf?src-supplier=Digi-Key; ComponentLink4URL: https://datasheet.ciiva.com/2453/pyu-r-int-thick-7-2453478.pdf?src-supplier=Digi-Key; ComponentLink4Description: https://datasheet.ciiva.com/2453/pyu-r-int-thick-7-2453478.pdf?src-supplier=Digi-Key; ComponentLink5URL: https://datasheet.ciiva.com/5558/pyu-rc0402-51-rohs-l-6-r-5558279.pdf?src-supplier=Mouser; ComponentLink5Description: https://datasheet.ciiva.com/5558/pyu-rc0402-51-rohs-l-6-r-5558279.pdf?src-supplier=Mouser; ComponentLink6URL: https://datasheet.ciiva.com/7850/1018594-7850045.pdf?src-supplier=Element14; ComponentLink6Description: https://datasheet.ciiva.com/7850/1018594-7850045.pdf?src-supplier=Element14; ComponentLink7URL: https://datasheet.ciiva.com/7850/1018594-7850044.pdf?src-supplier=Element14; ComponentLink7Description: https://datasheet.ciiva.com/7850/1018594-7850044.pdf?src-supplier=Element14; Supplier Part Number 1: 3873767; LCSC Part Number: C114756
R45 = RC0402FR-079K1L: RES 9.1K OHM 1% 1/16W 0402; Manufacturer: Yageo; Value: 9.1kR; Temperature Coefficient: 100ppm/°C; Power Rating: 63mW; Voltage Rating: 50V; Item Type: Resistor; Supplier: Future Electronics; Supplier Part Number: 8081614; Manufacturer Part Number: RC0402FR-079K1L; RoHS: Yes; Category: Chip SMD Resistors; Stock: 70000; Pricing: 10000=0.0012, 100000=0.0011, 300000=0.001, 750000=0.001, 2000000=0.0009 (USD); Case/Package: 0402; Contact Plating: Tin,Matte; Case Code (Imperial): 0402; Case Code (Metric): 1005; Min Operating Temperature: -55°C; Max Operating Temperature: 155°C; Tolerance: 1%; Resistor Type: Thick Film; Package Quantity: 1; Packaging: Tape and Reel; Termination: SMD/SMT; Number of Terminations: 2; Max Power Dissipation: 63mW; Features: Moisture Resistant; Series: RC; Construction: Rectangular; Resistance Tolerance: 1%; Voltage Rating (DC): 50V; Length: 1mm; Width: 0.02inch; Height: 0.016inch; Depth: 0.5mm; Military Standard: Not; RoHS Compliant: Yes; Reach SVHC Compliant: Unknown; Lead Free: 5697LeadFree; ComponentLink1URL: https://datasheet.ciiva.com/7850/1018594-7850124.pdf?src-supplier=Element14; ComponentLink1Description: https://datasheet.ciiva.com/7850/1018594-7850124.pdf?src-supplier=Element14; ComponentLink2URL: https://datasheet.ciiva.com/7850/1018594-7850123.pdf?src-supplier=Element14; ComponentLink2Description: https://datasheet.ciiva.com/7850/1018594-7850123.pdf?src-supplier=Element14; ComponentLink3URL: https://datasheet.ciiva.com/2491/pyu-r-int-thick-7-2491238.pdf?src-supplier=Digikey; ComponentLink3Description: https://datasheet.ciiva.com/2491/pyu-r-int-thick-7-2491238.pdf?src-supplier=Digikey; ComponentLink4URL: https://datasheet.ciiva.com/2491/pyu-r-int-thick-7-2491239.pdf?src-supplier=Digikey; ComponentLink4Description: https://datasheet.ciiva.com/2491/pyu-r-int-thick-7-2491239.pdf?src-supplier=Digikey; ComponentLink5URL: https://datasheet.ciiva.com/8891/pyu-rc0402-51-rohs-l-6-8891518.pdf?src-supplier=Avnet; ComponentLink5Description: https://datasheet.ciiva.com/8891/pyu-rc0402-51-rohs-l-6-8891518.pdf?src-supplier=Avnet; ComponentLink6URL: https://datasheet.ciiva.com/17068/pyu-rc0402-51-rohs-l-6-r-17068454.pdf?src-supplier=Future+Electronics; ComponentLink6Description: https://datasheet.ciiva.com/17068/pyu-rc0402-51-rohs-l-6-r-17068454.pdf?src-supplier=Future+Electronics; ComponentLink7URL: https://datasheet.ciiva.com/2491/pyu-r-int-thick-7-2491237.pdf?src-supplier=Digikey; ComponentLink7Description: https://datasheet.ciiva.com/2491/pyu-r-int-thick-7-2491237.pdf?src-supplier=Digikey; LCSC Part Number: C163450
R46 R49 R50 R68 = RC0402FR-07200KL: RES 200K OHM 1% 1/16W 0402; Manufacturer: Yageo; Item Type: Resistor; Power Rating: 63mW; Temperature Coefficient: 100ppm/°C; Value: 200kR; Voltage Rating: 50V; Supplier: Future Electronics; LCSC Part Number: C114763; Manufacturer Part Number: RC0402FR-07200KL; RoHS: Yes; Stock: 290000; Pricing: 10000=0.0004, 50000=0.0008, 150000=0.0004, 300000=0.0007, 400000=0.0004, 1000000=0.0004, 2500000=0.0004, 3000000=0.0006 (USD); Case/Package: 0402; Case Code (Metric): 1005; Case Code (Imperial): 0402; Min Operating Temperature: -55°C; Max Operating Temperature: 155°C; Tolerance: 1%; Packaging: Tape and Reel; Termination: SMD/SMT; Series: RC; Technology: THICK FILM; Package Quantity: 1; Resistor Type: Thick Film; Number of Terminations: 2; Max Power Dissipation: 63mW; Working Voltage: 50V; Features: Moisture Resistant; Construction: Rectangular; Resistance Tolerance: 1%; Voltage Rating (DC): 50V; Length: 0.039inch; Width: 0.02inch; Height: 0.016inch; Depth: 0.5mm; RoHS Compliant: Yes; Lead Free: 5697LeadFree; Military Standard: Not; Reach SVHC Compliant: Unknown; ComponentLink1URL: https://datasheet.ciiva.com/7849/1018594-7849897.pdf?src-supplier=Element14; ComponentLink1Description: https://datasheet.ciiva.com/7849/1018594-7849897.pdf?src-supplier=Element14; ComponentLink2URL: https://datasheet.ciiva.com/7849/1018594-7849896.pdf?src-supplier=Element14; ComponentLink2Description: https://datasheet.ciiva.com/7849/1018594-7849896.pdf?src-supplier=Element14; ComponentLink3URL: https://datasheet.ciiva.com/46394/1018594-46394953.pdf?src-supplier=Element14; ComponentLink3Description: https://datasheet.ciiva.com/46394/1018594-46394953.pdf?src-supplier=Element14; ComponentLink4URL: https://datasheet.ciiva.com/2453/pyu-r-int-thick-7-2453557.pdf?src-supplier=Digikey; ComponentLink4Description: https://datasheet.ciiva.com/2453/pyu-r-int-thick-7-2453557.pdf?src-supplier=Digikey; ComponentLink5URL: https://datasheet.ciiva.com/2453/pyu-r-int-thick-7-2453558.pdf?src-supplier=Digikey; ComponentLink5Description: https://datasheet.ciiva.com/2453/pyu-r-int-thick-7-2453558.pdf?src-supplier=Digikey; ComponentLink6URL: https://datasheet.ciiva.com/2453/pyu-r-int-thick-7-2453556.pdf?src-supplier=Digikey; ComponentLink6Description: https://datasheet.ciiva.com/2453/pyu-r-int-thick-7-2453556.pdf?src-supplier=Digikey; ComponentLink7URL: https://datasheet.ciiva.com/12667/pyu-rc0402-51-rohs-l-6-r-12667911.pdf?src-supplier=Mouser; ComponentLink7Description: https://datasheet.ciiva.com/12667/pyu-rc0402-51-rohs-l-6-r-12667911.pdf?src-supplier=Mouser; ComponentLink8URL: https://datasheet.ciiva.com/15189/getdatasheetpartid-323720-15189381.pdf?src-supplier=Verical; ComponentLink8Description: https://datasheet.ciiva.com/15189/getdatasheetpartid-323720-15189381.pdf?src-supplier=Verical; ComponentLink9URL: https://datasheet.ciiva.com/16740/pyu-rc0402-51-rohs-l-6-r-16740636.pdf?src-supplier=Future+Electronics; ComponentLink9Description: https://datasheet.ciiva.com/16740/pyu-rc0402-51-rohs-l-6-r-16740636.pdf?src-supplier=Future+Electronics
R51 = RT0402BRD07150KL: RES 150K OHM 0.1% 1/16W 0402; Manufacturer: Yageo; Item Type: Resistor; Supplier: Future Electronics; Supplier Part Number: 3102901; Manufacturer Part Number: RT0402BRD07150KL; RoHS: Yes; Category: Chip SMD Resistors; Stock: 20000; Pricing: 10000=0.0218, 20000=0.0213, 30000=0.021, 50000=0.0206, 100000=0.0199 (USD); RoHS Compliant: Yes; LCSC Part Number: C852538
R52 = AT0402DRD0790K9L: RES SMD 90.9KOHM 0.5% 1/16W 0402; Manufacturer: Yageo; Item Type: Resistor; Value: 90.9kR; Max Power Dissipation: 63mW; Temperature Coefficient: 25ppm/°C; Supplier: Digikey; LCSC Part Number: C851529; Manufacturer Part Number: AT0402DRD0790K9L; RoHS: Yes; Pricing: 10000=0.03114 (USD); Case/Package: 0402; Min Operating Temperature: -55°C; Max Operating Temperature: 155°C; Packaging: Tape and Reel; Number of Terminations: 2; Tolerance: 0.5%; Features: Moisture Resistant,Automotive AEC-Q200,Anti-Sulfur; Series: AT; Length: 0.039inch; Width: 0.02inch; Height: 0.014inch; RoHS Compliant: Yes; ComponentLink1URL: http://www.yageo.com/documents/recent/PYu-AT_51_RoHS_L-3.pdf?src-supplier=Digikey; ComponentLink1Description: http://www.yageo.com/documents/recent/PYu-AT_51_RoHS_L-3.pdf?src-supplier=Digikey
R55 = RC0603FR-071ML: RES SMD 1M OHM 1% 1/10W 0603; Manufacturer: Yageo; Voltage Rating: 50V; Resistance: 1MR; Power Rating: 100mW; Temperature Coefficient: 100ppm/°C; Item Type: Resistor; Supplier 1: Digi-Key; Manufacturer Part Number: RC0603FR-071ML; Stock 1: 3824601; Pricing 1: 1=0.1, 10=0.023, 100=0.0094, 1000=0.00421, 2500=0.00366 (USD); Case/Package: 0603; Number of Pins: 2; Case Code (Imperial): 0603; Case Code (Metric): 1608; Min Operating Temperature: -55°C; Max Operating Temperature: 155°C; Voltage Rating (DC): 50V; Tolerance: 1%; Packaging: Tape and Reel; Package Quantity: 5000; Termination: SMD/SMT; Composition: Thick Film; Military Standard: Not; Length: 1.6mm; Height: 0.45mm; Width: 0.8mm; Depth: 0.8mm; REACH SVHC: No SVHC; Lead Free: Lead Free; ComponentLink1URL: http://www.farnell.com/datasheets/2167052.pdf?src-supplier=Mouser; ComponentLink1Description: http://www.farnell.com/datasheets/2167052.pdf?src-supplier=Mouser; ComponentLink2URL: http://www.farnell.com/datasheets/2167052.pdf?src-supplier=Element14; ComponentLink2Description: http://www.farnell.com/datasheets/2167052.pdf?src-supplier=Element14; ComponentLink3URL: http://documents.rs-components.com/techlib://itc_doclist_GB.htm?stockno=5048956&src-supplier=RSComponents; ComponentLink3Description: http://documents.rs-components.com/techlib://itc_doclist_GB.htm?stockno=5048956&src-supplier=RSComponents; Supplier Part Number 1: 311-1.00MHRDKR-ND; LCSC Part Number: C105578
R56 R58 R74 = RC0402FR-070RL: RES 0 OHM JUMPER 1/16W 0402; Manufacturer: Yageo; Item Type: Resistors; Tolerance: 1%; Power Rating: 62.5mW; Voltage Rating: 50V; Temperature Coefficient: 200ppm/°C; Max Power Dissipation: 63mW; Supplier 1: Mouser; Manufacturer Part Number: RC0402FR-070RL; RoHS: Yes; Stock 1: 8556842; Pricing 1: 1=0.10000, 10=0.01400, 50=0.01400, 100=0.00600, 1000=0.00300, 5000=0.00200, 10000=0.00100 (USD); Mount: Surface Mount; Case/Package: 0402; Contact Plating: Tin,Matte; Case Code (Imperial): 0402; Case Code (Metric): 1005; Size Code: 0402; Min Operating Temperature: -55°C; Max Operating Temperature: 155°C; Resistance: 0R; Resistor Type: Thick Film; Packaging: Tape and Reel; Termination: SMD/SMT; Features: Moisture Resistant; Series: RC; Number of Terminations: 2; Length: 1mm; Width: 0.5mm; Height: 0.35mm; Radiation Hardening: No; Lead Free: Lead Free; RoHS Compliant: Yes; ComponentLink1URL: https://datasheet.ciiva.com/8896/pyu-rc0402-51-rohs-l-6-8896149.pdf?src-supplier=Avnet; ComponentLink1Description: https://datasheet.ciiva.com/8896/pyu-rc0402-51-rohs-l-6-8896149.pdf?src-supplier=Avnet; ComponentLink2URL: https://datasheet.ciiva.com/16790/pyu-rc0402-51-rohs-l-6-r-16790444.pdf?src-supplier=Future+Electronics; ComponentLink2Description: https://datasheet.ciiva.com/16790/pyu-rc0402-51-rohs-l-6-r-16790444.pdf?src-supplier=Future+Electronics; Supplier Part Number 1: 603-RC0402FR-070RL; LCSC Part Number: C106231
R57 = RC0402FR-074K7L: RES 4.7K OHM 1% 1/16W 0402; Manufacturer: Yageo; Voltage Rating (DC): 50V; Power Rating: 62.5mW; Resistance: 4.7kR; Temperature Coefficient: 100ppm/°C; Max Power Dissipation: 63mW; Item Type: Resistor; Supplier 1: Avnet; Manufacturer Part Number: RC0402FR-074K7L; RoHS: Yes; Category: Chip SMD Resistors; Stock 1: 2420000; Pricing 1: 10000=0.00085 (USD); Case/Package: 0402; Number of Pins: 2; Case Code (Imperial): 0402; Case Code (Metric): 1005; Size Code: 0402; Min Operating Temperature: -55°C; Max Operating Temperature: 155°C; Tolerance: 1%; Voltage Rating: 50V; Packaging: Tape and Reel; Resistor Type: Thick Film; Termination: SMD/SMT; Features: Moisture Resistant; Series: RC; Number of Terminations: 2; Resistance Tolerance: 1%; Construction: Rectangular; Length: 1mm; Width: 0.5mm; Height: 0.32mm; Depth: 0.5mm; Height - Seated (Max): 0.016inch; RoHS Compliant: Yes; Reach SVHC Compliant: Yes; Military Standard: Not; Lead Free: Lead Free; ComponentLink1URL: https://datasheet.ciiva.com/22661/1686128-22661342.pdf?src-supplier=Element14; ComponentLink1Description: https://datasheet.ciiva.com/22661/1686128-22661342.pdf?src-supplier=Element14; ComponentLink2URL: https://datasheet.ciiva.com/7850/1018594-7850022.pdf?src-supplier=Element14; ComponentLink2Description: https://datasheet.ciiva.com/7850/1018594-7850022.pdf?src-supplier=Element14; ComponentLink3URL: https://datasheet.ciiva.com/7850/1018594-7850023.pdf?src-supplier=Element14; ComponentLink3Description: https://datasheet.ciiva.com/7850/1018594-7850023.pdf?src-supplier=Element14; ComponentLink4URL: https://datasheet.ciiva.com/15215/getdatasheetpartid-328119-15215035.pdf?src-supplier=Verical; ComponentLink4Description: https://datasheet.ciiva.com/15215/getdatasheetpartid-328119-15215035.pdf?src-supplier=Verical; Supplier Part Number 1: RC0402FR-074K7L; LCSC Part Number: C105871
R59 R71-R73 = RC0402FR-07100KL: RES 100K OHM 1% 1/16W 0402; Manufacturer: Yageo; Resistance: 100kR; Temperature Coefficient: 100ppm/°C; Power Rating: 63mW; Voltage Rating: 50V; Item Type: Resistor; Supplier 1: Mouser; Manufacturer Part Number: RC0402FR-07100KL; RoHS: Yes; Category: Chip SMD Resistors; Stock 1: 7759549; Pricing 1: 1=0.10000, 10=0.01200, 50=0.01200, 100=0.00500, 1000=0.00300, 2500=0.00200, 10000=0.00100 (USD); Case/Package: 0402; Case Code (Metric): 1005; Case Code (Imperial): 0402; Min Operating Temperature: -55°C; Max Operating Temperature: 155°C; Resistor Type: Thick Film; Tolerance: 1%; Packaging: Tape and Reel; Package Quantity: 1; Number of Terminations: 2; Termination: SMD/SMT; Max Power Dissipation: 63mW; Working Voltage: 50V; Features: Moisture Resistant; Series: RC; Resistance Tolerance: 1%; Construction: Rectangular; Technology: THICK FILM; Length: 0.039inch; Width: 0.02inch; Height: 0.016inch; Depth: 0.5mm; REACH SVHC: No SVHC; Lead Free: Lead Free; RoHS Compliant: Yes; Military Standard: Not; ComponentLink1URL: https://datasheet.ciiva.com/11819/0900766b80c66297-11819452.pdf?src-supplier=RSComponents; ComponentLink1Description: https://datasheet.ciiva.com/11819/0900766b80c66297-11819452.pdf?src-supplier=RSComponents; ComponentLink2URL: https://datasheet.ciiva.com/22747/1018594-22747509.pdf?src-supplier=Element14; ComponentLink2Description: https://datasheet.ciiva.com/22747/1018594-22747509.pdf?src-supplier=Element14; ComponentLink3URL: https://datasheet.ciiva.com/2453/pyu-r-int-thick-7-2453362.pdf?src-supplier=Digi-Key; ComponentLink3Description: https://datasheet.ciiva.com/2453/pyu-r-int-thick-7-2453362.pdf?src-supplier=Digi-Key; ComponentLink4URL: https://datasheet.ciiva.com/2453/pyu-r-int-thick-7-2453363.pdf?src-supplier=Digi-Key; ComponentLink4Description: https://datasheet.ciiva.com/2453/pyu-r-int-thick-7-2453363.pdf?src-supplier=Digi-Key; ComponentLink5URL: https://datasheet.ciiva.com/2453/pyu-r-int-thick-7-2453361.pdf?src-supplier=Digi-Key; ComponentLink5Description: https://datasheet.ciiva.com/2453/pyu-r-int-thick-7-2453361.pdf?src-supplier=Digi-Key; ComponentLink6URL: https://datasheet.ciiva.com/12667/pyu-rc0402-51-rohs-l-6-r-12667930.pdf?src-supplier=Mouser; ComponentLink6Description: https://datasheet.ciiva.com/12667/pyu-rc0402-51-rohs-l-6-r-12667930.pdf?src-supplier=Mouser; ComponentLink7URL: https://datasheet.ciiva.com/15189/getdatasheetpartid-323696-15189334.pdf?src-supplier=Verical; ComponentLink7Description: https://datasheet.ciiva.com/15189/getdatasheetpartid-323696-15189334.pdf?src-supplier=Verical; Supplier Part Number 1: 603-RC0402FR-07100KL; LCSC Part Number: C60491
R62 = RC0402FR-070RL: RES 0 OHM JUMPER 1/16W 0402; Manufacturer: Yageo; Item Type: Resistors; Resistance: 0R; Tolerance: 1%; Power Rating: 62.5mW; Voltage Rating: 50V; Temperature Coefficient: 200ppm/°C; Max Power Dissipation: 63mW; Supplier 1: Mouser; Manufacturer Part Number: RC0402FR-070RL; RoHS: Yes; Stock 1: 8556842; Pricing 1: 1=0.10000, 10=0.01400, 50=0.01400, 100=0.00600, 1000=0.00300, 5000=0.00200, 10000=0.00100 (USD); Mount: Surface Mount; Case/Package: 0402; Contact Plating: Tin,Matte; Case Code (Imperial): 0402; Case Code (Metric): 1005; Size Code: 0402; Min Operating Temperature: -55°C; Max Operating Temperature: 155°C; Resistor Type: Thick Film; Packaging: Tape and Reel; Termination: SMD/SMT; Features: Moisture Resistant; Series: RC; Number of Terminations: 2; Length: 1mm; Width: 0.5mm; Height: 0.35mm; Radiation Hardening: No; Lead Free: Lead Free; RoHS Compliant: Yes; ComponentLink1URL: https://datasheet.ciiva.com/8896/pyu-rc0402-51-rohs-l-6-8896149.pdf?src-supplier=Avnet; ComponentLink1Description: https://datasheet.ciiva.com/8896/pyu-rc0402-51-rohs-l-6-8896149.pdf?src-supplier=Avnet; ComponentLink2URL: https://datasheet.ciiva.com/16790/pyu-rc0402-51-rohs-l-6-r-16790444.pdf?src-supplier=Future+Electronics; ComponentLink2Description: https://datasheet.ciiva.com/16790/pyu-rc0402-51-rohs-l-6-r-16790444.pdf?src-supplier=Future+Electronics; Supplier Part Number 1: 603-RC0402FR-070RL; LCSC Part Number: C106231
R63 = AR03BTC5003N: 62.5mW ±25ppm/℃ ±0.1% 500kΩ 0603 Chip Resistor - Surface Mount ROHS; Manufacturer: Viking Tech; Manufacturer Part Number: AR03BTC5003N; Package: 0603; LCSC Part Number: C412382; Item Type: Resistor; ComponentLink1Description: LCSC; ComponentLink1URL: https://www.lcsc.com/product-detail/Chip-Resistor-Surface-Mount_Viking-Tech-AR03BTC5003N_C412382.html
R64 = AR05BTCW4003: 125mW ±25ppm/℃ ±0.1% 400kΩ 0805 Chip Resistor - Surface Mount ROHS; Manufacturer: Viking Tech; Manufacturer Part Number: AR05BTCW4003; Package: 0805; LCSC Part Number: C3013969; Item Type: Resistor; ComponentLink1Description: LCSC; ComponentLink1URL: https://www.lcsc.com/product-detail/Chip-Resistor-Surface-Mount_Viking-Tech-AR05BTCW4003_C3013969.html
R67 = AR05BTCW1253: 125mW Thin Film Resistor 100V ±25ppm/℃ ±0.1% 125kΩ 0805 Chip Resistor - Surface Mount ROHS; Manufacturer: Viking Tech; Manufacturer Part Number: AR05BTCW1253; Package: 0805; LCSC Part Number: C316205; Item Type: Resistor; ComponentLink1Description: LCSC; ComponentLink1URL: https://www.lcsc.com/product-detail/Chip-Resistor-Surface-Mount_Viking-Tech-AR05BTCW1253_C316205.html
U8 = TUSB8041RGCR: IC HUB CONTROLLER USB 64VQFN; Manufacturer: Texas Instruments; Supplier: Mouser; LCSC Part Number: C486066; Manufacturer Part Number: TUSB8041RGCR; RoHS: Yes; Item Type: IC; Stock: 5065; Pricing: 1=6.99, 10=6.39, 50=6.12, 100=5.43, 1000=4.5, 10000=4.34 (USD); Length: 9mm; Width: 9mm; Height: 1mm; Thickness: 880um; ComponentLink1URL: http://www.ti.com/general/docs/suppproductinfo.tsp?distId=10&amp;gotoUrl=http%3A%2F%2Fwww.ti.com%2Flit%2Fgpn%2Ftusb8041&src-supplier=Digikey; ComponentLink1Description: http://www.ti.com/general/docs/suppproductinfo.tsp?distId=10&amp;gotoUrl=http%3A%2F%2Fwww.ti.com%2Flit%2Fgpn%2Ftusb8041&src-supplier=Digikey; ComponentLink2URL: http://www.ti.com/lit/ds/symlink/tusb8041.pdf?src-supplier=Digikey; ComponentLink2Description: http://www.ti.com/lit/ds/symlink/tusb8041.pdf?src-supplier=Digikey; ComponentLink3URL: http://www.ti.com/lit/gpn/tusb8041?src-supplier=Mouser; ComponentLink3Description: http://www.ti.com/lit/gpn/tusb8041?src-supplier=Mouser; ComponentLink4URL: http://www.ti.com/general/docs/lit/getliterature.tsp?genericPartNumber=TUSB8041&&fileType=pdf&src-supplier=Avnet; ComponentLink4Description: http://www.ti.com/general/docs/lit/getliterature.tsp?genericPartNumber=TUSB8041&&fileType=pdf&src-supplier=Avnet
U9 = HD3SS3220IRNHR: IC DRP PORT CTLR USB-C 30WQFN; Manufacturer: Texas Instruments; Supplier: Mouser; LCSC Part Number: C701817; Manufacturer Part Number: HD3SS3220IRNHR; RoHS: Yes; Item Type: IC; Stock: 2435; Pricing: 1=3.3, 10=2.29, 50=2.29, 100=2.03, 1000=1.8, 10000=1.62 (USD); ComponentLink1URL: http://www.ti.com/lit/gpn/hd3ss3220?src-supplier=Mouser; ComponentLink1Description: http://www.ti.com/lit/gpn/hd3ss3220?src-supplier=Mouser; ComponentLink2URL: http://www.ti.com/lit/ds/symlink/hd3ss3220.pdf?src-supplier=Digikey; ComponentLink2Description: http://www.ti.com/lit/ds/symlink/hd3ss3220.pdf?src-supplier=Digikey; ComponentLink3URL: http://www.ti.com/general/docs/suppproductinfo.tsp?distId=10&amp;gotoUrl=http%3A%2F%2Fwww.ti.com%2Flit%2Fgpn%2Fhd3ss3220&src-supplier=Digikey; ComponentLink3Description: http://www.ti.com/general/docs/suppproductinfo.tsp?distId=10&amp;gotoUrl=http%3A%2F%2Fwww.ti.com%2Flit%2Fgpn%2Fhd3ss3220&src-supplier=Digikey
U10 = TLV62569DBVR: IC REG BUCK ADJ 2A SOT23-5; Manufacturer: Texas Instruments; Supplier: Mouser; LCSC Part Number: C141836; Manufacturer Part Number: TLV62569DBVR; RoHS: Yes; Item Type: IC; Stock: 6385; Pricing: 1=0.47, 10=0.248, 50=0.248, 100=0.143, 1000=0.12, 10000=0.086 (USD); ComponentLink1URL: http://www.ti.com/lit/ds/symlink/tlv62569.pdf?src-supplier=Farnell; ComponentLink1Description: http://www.ti.com/lit/ds/symlink/tlv62569.pdf?src-supplier=Farnell; ComponentLink2URL: http://www.ti.com/lit/ds/symlink/tlv62569.pdf?src-supplier=Digikey; ComponentLink2Description: http://www.ti.com/lit/ds/symlink/tlv62569.pdf?src-supplier=Digikey
U11 = TPS2003CDRCR: IC PWR SWITCH N-CHAN 1:2 10VSON; Manufacturer: Texas Instruments; Supplier: Mouser; LCSC Part Number: C2149914; Manufacturer Part Number: TPS2003CDRCR; RoHS: Yes; Item Type: IC; Stock: 5869; Pricing: 1=1.5, 10=1.07, 50=1.07, 100=0.867, 1000=0.723, 10000=0.5 (USD); ComponentLink1URL: https://datasheet.ciiva.com/6602/tps2003c-6602992.pdf?src-supplier=Digikey; ComponentLink1Description: https://datasheet.ciiva.com/6602/tps2003c-6602992.pdf?src-supplier=Digikey
U14 = CSD17313Q2: 30V 5A 2.3W 30mΩ@4A,8V null WSON-6 MOSFETs ROHS; Manufacturer: Texas Instruments; Item Type: IC; Supplier: Mouser; Supplier Part Number: 595-CSD17313Q2; Manufacturer Part Number: CSD17313Q2; RoHS: Yes; Category: MOSFETs; Stock: 12528; Pricing: 1=0.59, 10=0.502, 50=0.502, 100=0.375, 1000=0.228, 10000=0.156 (USD); ComponentLink1URL: https://datasheet.ciiva.com/6388/csd17313q2-6388183.pdf?src-supplier=Digi-Key; ComponentLink1Description: https://datasheet.ciiva.com/6388/csd17313q2-6388183.pdf?src-supplier=Digi-Key; ComponentLink2URL: https://datasheet.ciiva.com/4438/slps260b-128048-4438543.pdf?src-supplier=Mouser; ComponentLink2Description: https://datasheet.ciiva.com/4438/slps260b-128048-4438543.pdf?src-supplier=Mouser; ComponentLink3URL: https://datasheet.ciiva.com/1255/csd17313q2-1255358.pdf?src-supplier=Newark; ComponentLink3Description: https://datasheet.ciiva.com/1255/csd17313q2-1255358.pdf?src-supplier=Newark; ComponentLink4URL: https://datasheet.ciiva.com/7968/1536237-7968249.pdf?src-supplier=Element14; ComponentLink4Description: https://datasheet.ciiva.com/7968/1536237-7968249.pdf?src-supplier=Element14; LCSC Part Number: C2863837
U15 = TPS25910RSAT: IC HOT SWAP CTRLR GP 16QFN; Manufacturer: Texas Instruments; Supplier: Mouser; Supplier Part Number: 595-TPS25910RSAT; Manufacturer Part Number: TPS25910RSAT; RoHS: Yes; Item Type: IC; Stock: 1261; Pricing: 1=4.06, 10=2.81, 50=2.81, 100=2.33, 1000=1.86, 10000=1.72 (USD); ComponentLink1URL: http://components.arrow.com/part/dataview/56333867S341209N7713?src-supplier=Arrow+Electronics; ComponentLink1Description: http://components.arrow.com/part/dataview/56333867S341209N7713?src-supplier=Arrow+Electronics; ComponentLink2URL: http://www.ti.com/general/docs/lit/getliterature.tsp?genericPartNumber=TPS25910&&fileType=pdf&src-supplier=Avnet; ComponentLink2Description: http://www.ti.com/general/docs/lit/getliterature.tsp?genericPartNumber=TPS25910&&fileType=pdf&src-supplier=Avnet; ComponentLink3URL: http://www.ti.com/lit/gpn/tps25910?src-supplier=Mouser; ComponentLink3Description: http://www.ti.com/lit/gpn/tps25910?src-supplier=Mouser; ComponentLink4URL: http://www.ti.com/general/docs/lit/getliterature.tsp?genericPartNumber=TPS25910&amp;&amp;fileType=pdf&src-supplier=Farnell; ComponentLink4Description: http://www.ti.com/general/docs/lit/getliterature.tsp?genericPartNumber=TPS25910&amp;&amp;fileType=pdf&src-supplier=Farnell; ComponentLink5URL: http://www.ti.com/lit/ds/symlink/tps25910.pdf?src-supplier=Digikey; ComponentLink5Description: http://www.ti.com/lit/ds/symlink/tps25910.pdf?src-supplier=Digikey; ComponentLink6URL: http://www.ti.com/general/docs/lit/getliterature.tsp?genericPartNumber=TPS25910&&fileType=pdf&src-supplier=Element14; ComponentLink6Description: http://www.ti.com/general/docs/lit/getliterature.tsp?genericPartNumber=TPS25910&&fileType=pdf&src-supplier=Element14
X2 = E3SB24E000009E: 24MHz 8pF ±10ppm SMD3225-4P Crystals ROHS; Manufacturer: Hosonic Elec; Manufacturer Part Number: E3SB24E000009E; Package: SMD3225-4P; LCSC Part Number: C5241161; Item Type: Crystal; ComponentLink1Description: LCSC; ComponentLink1URL: https://www.lcsc.com/product-detail/Crystals_Hosonic-Elec-E3SB24E000009E_C5241161.html